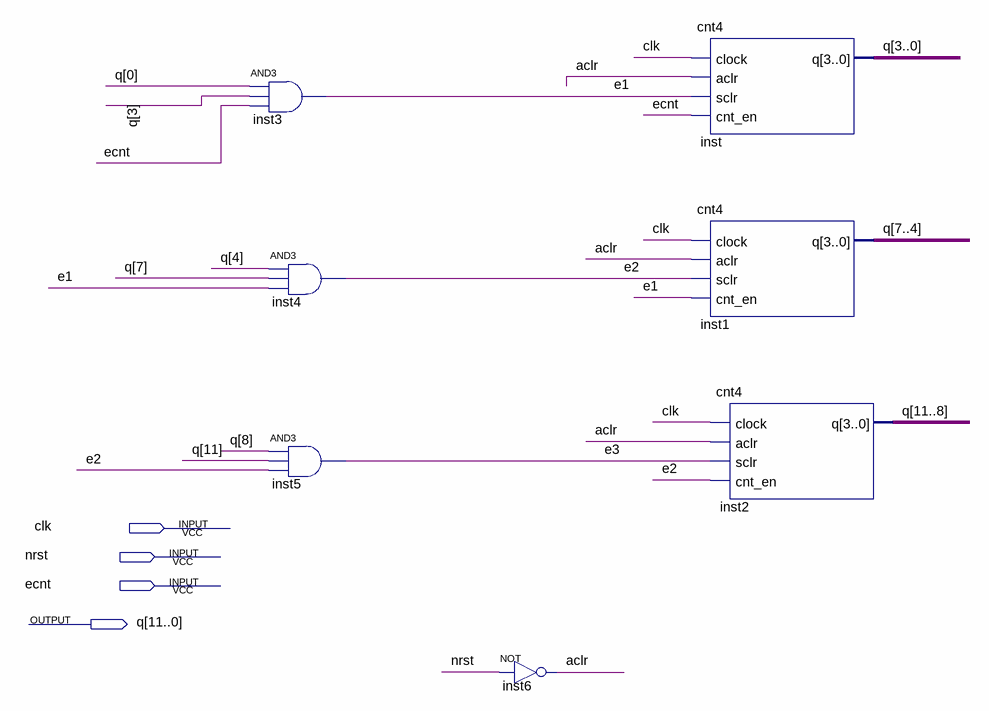
[diagram p0: schematic sheet]
// Quartus schematic BCDcnt3.bdf as structural Verilog: 7 symbols, 4 pins
module BCDcnt3 (
  input  clk,
  input  nrst,
  input  ecnt,
  output [11:0] q
);

  wire aclr, e1, e2, e3;

  and inst3 (e1, q[0], q[3], ecnt);
  and inst4 (e2, q[4], q[7], e1);
  and inst5 (e3, q[8], q[11], e2);
  not inst6 (aclr, nrst);
  cnt4 inst (.clock(clk), .aclr(aclr), .sclr(e1), .cnt_en(ecnt), .q(q[3:0]));
  cnt4 inst1 (.clock(clk), .aclr(aclr), .sclr(e2), .cnt_en(e1), .q(q[7:4]));
  cnt4 inst2 (.clock(clk), .aclr(aclr), .sclr(e3), .cnt_en(e2), .q(q[11:8]));
endmodule
